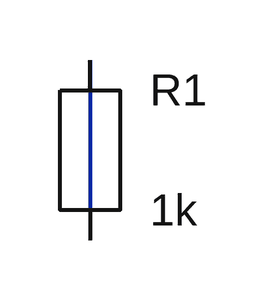
[diagram p0: schematic same_instance_bare.asc]
same_instance_bare.asc, the LTspice schematic file:
Version 4
SHEET 1 880 680
WIRE 96 96 96 192
SYMBOL res 96 144 R0
SYMATTR InstName R1
SYMATTR Value 1k

The netlist it stands for:
* same_instance_bare.asc
R1 N001 N001 1k
.backanno
.end